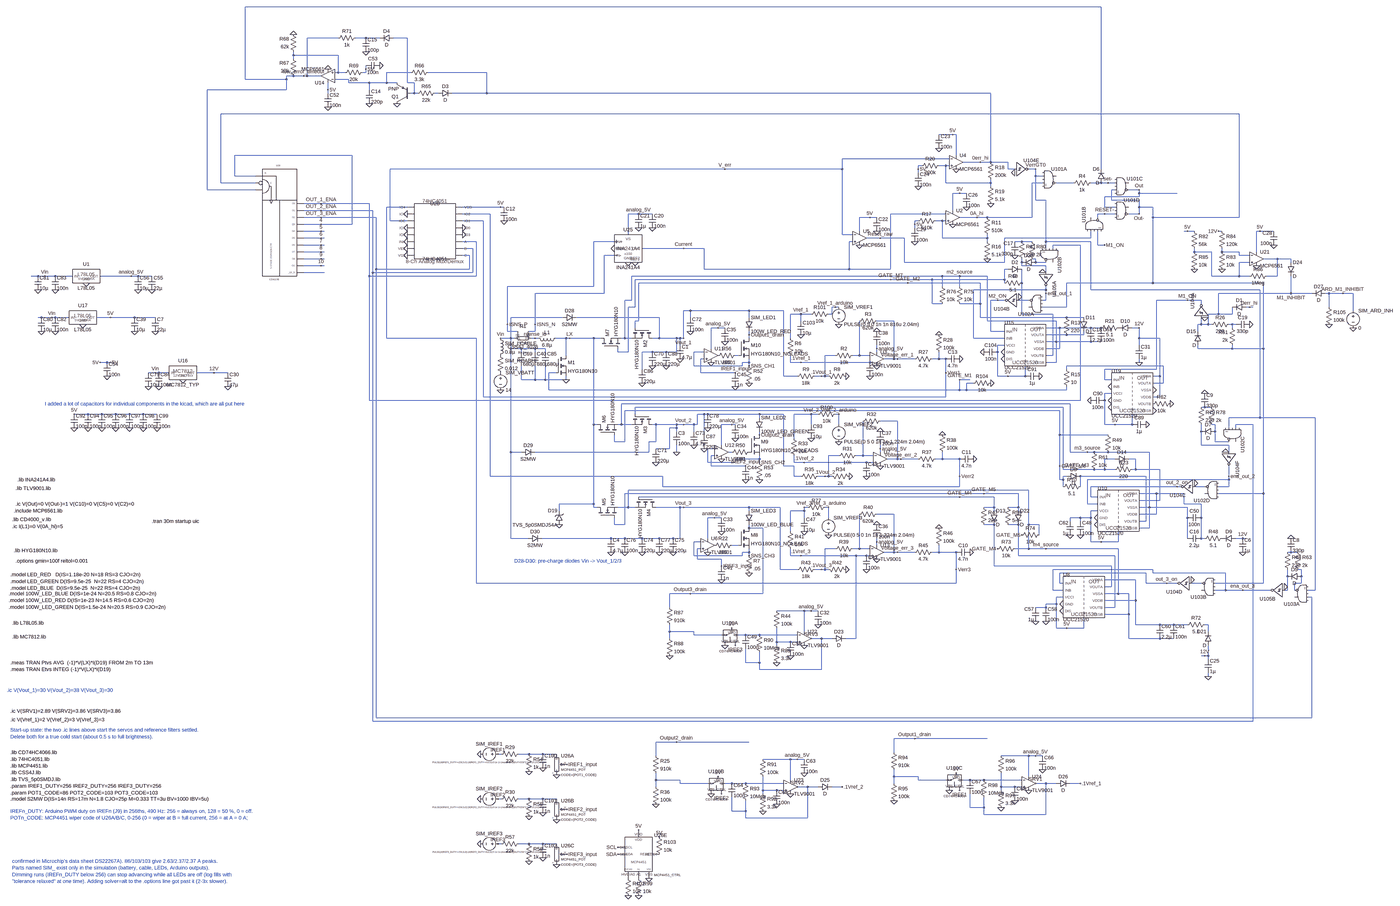
[diagram p0: schematic BOOST.asc, whole sheet]
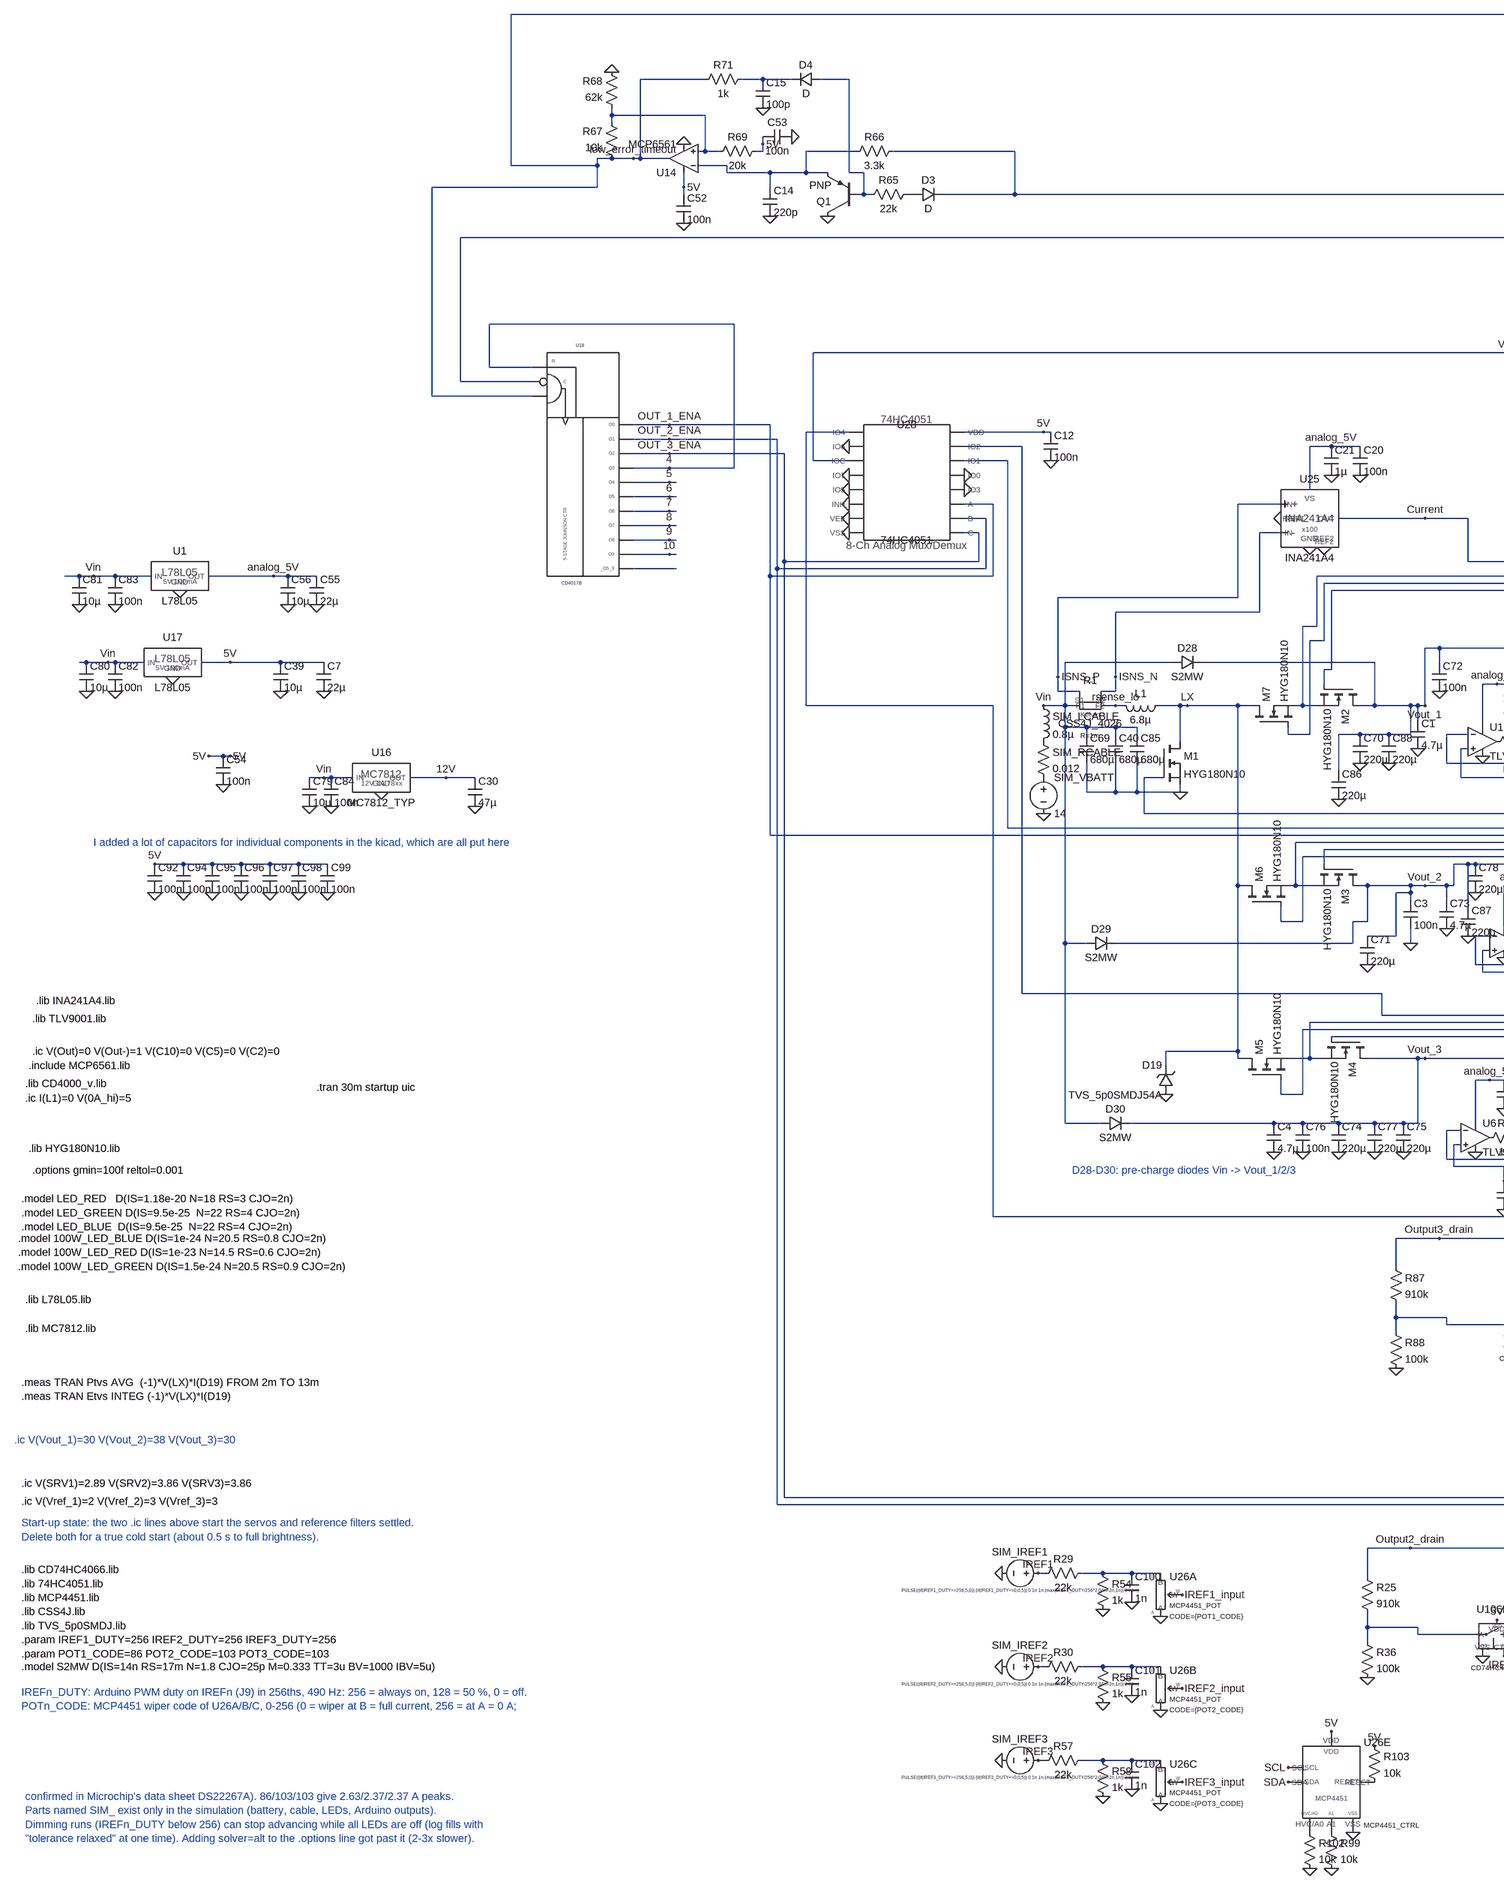
[diagram p1: schematic BOOST.asc, part, row 1 of 1, column 1 of 2]
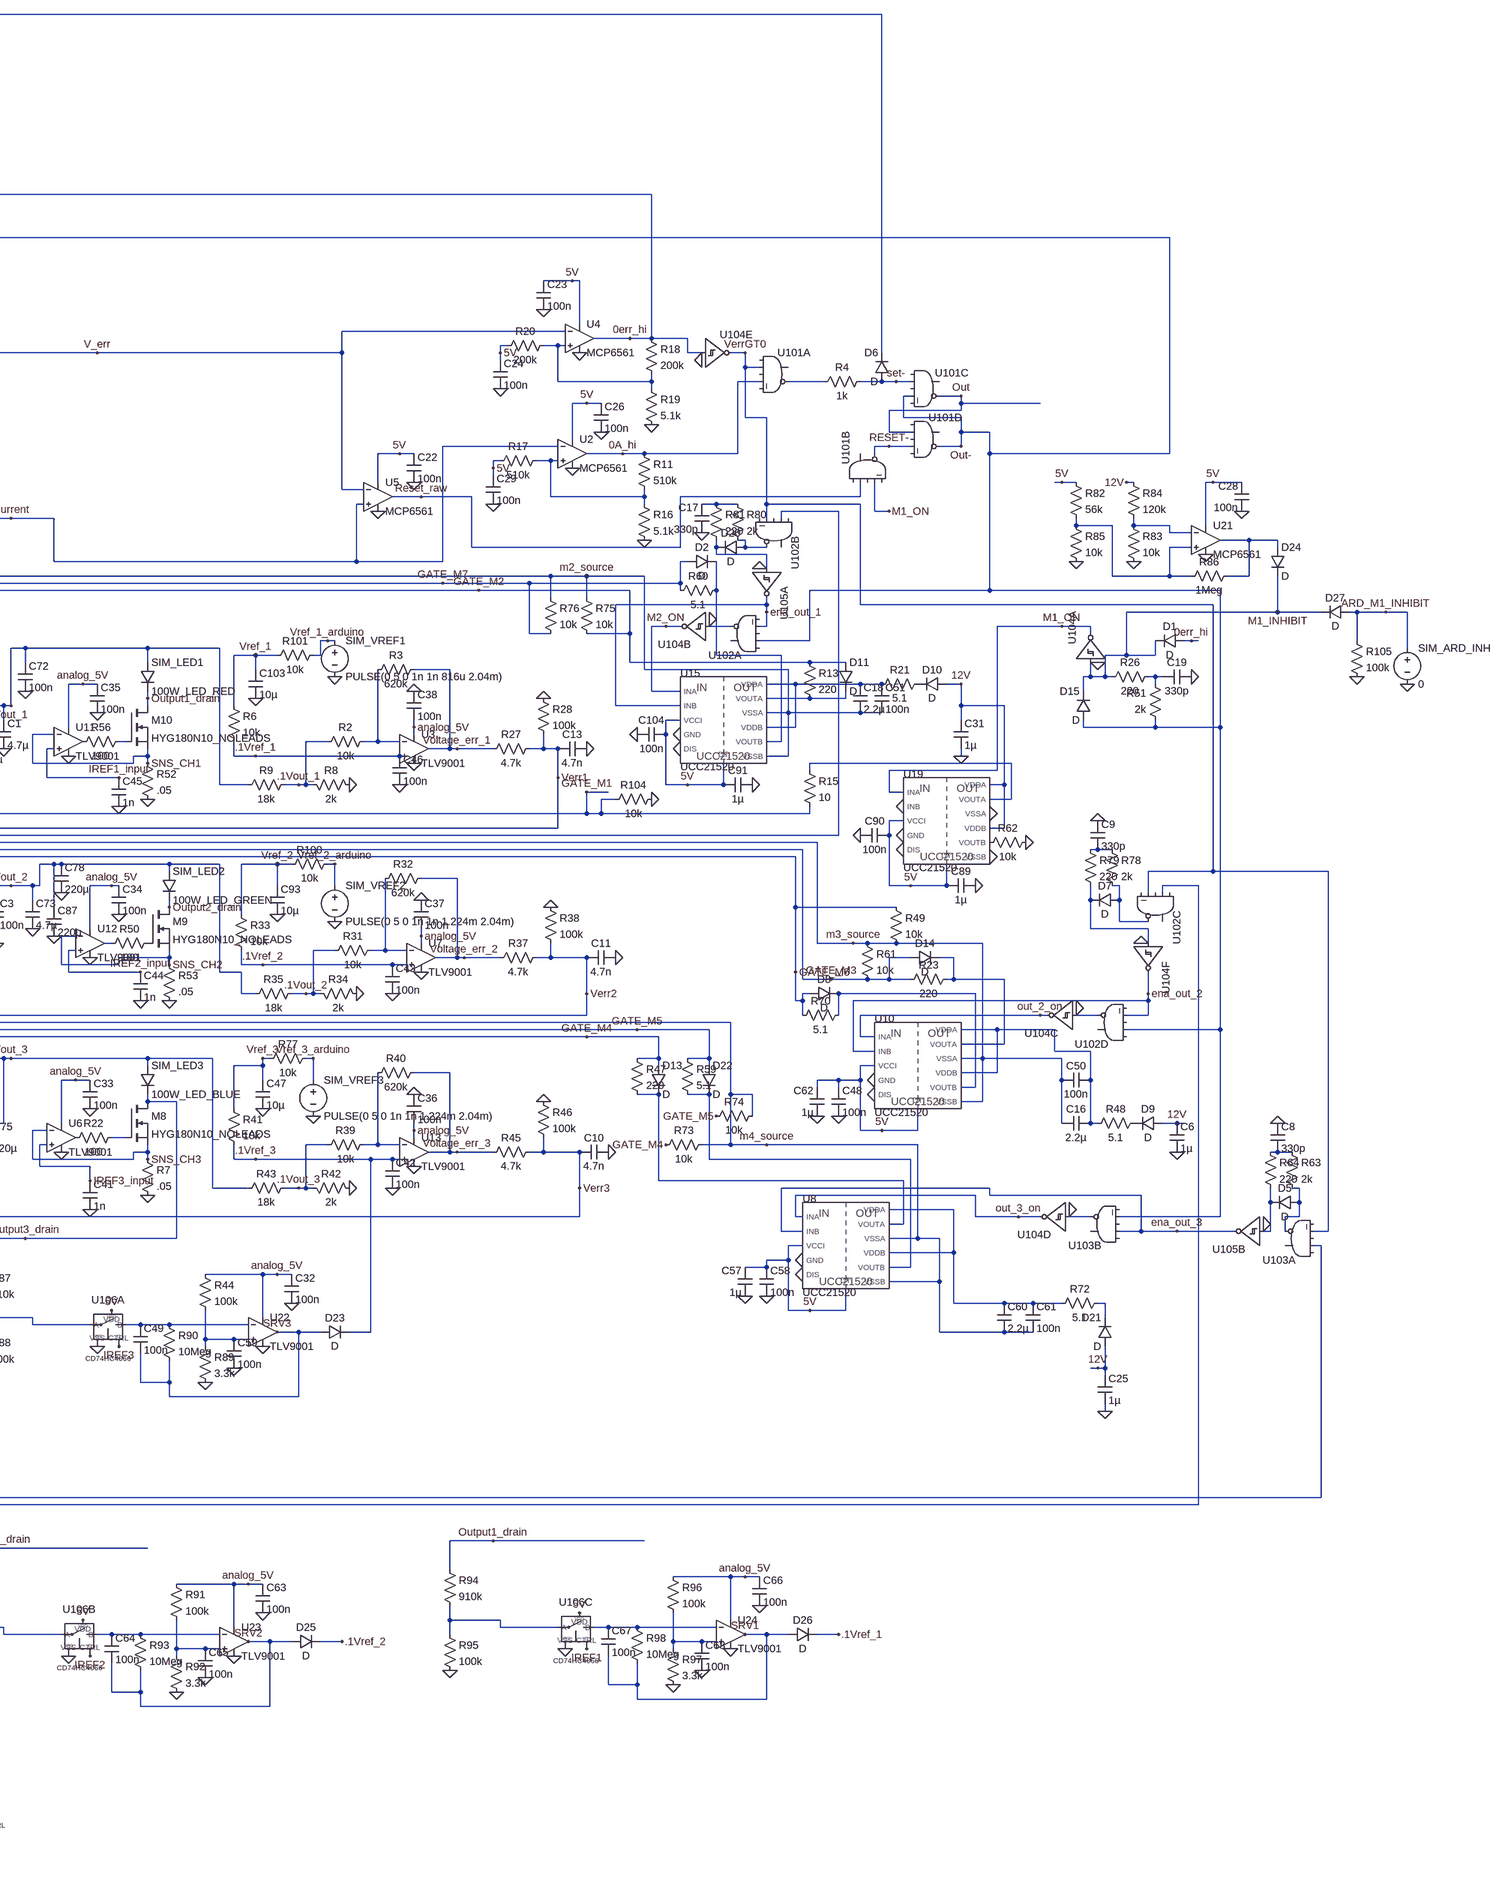
[diagram p2: schematic BOOST.asc, part, row 1 of 1, column 2 of 2]
* BOOST.asc
V§SIM_VBATT P001 0 14
L1 LX rsense_lo 6.8µ Ipk=55 Rser=1.6m
X§M1 LX GATE_M1 0 HYG180N10  ; pins D G S
X§M2 Vout_1 GATE_M2 m2_source HYG180N10  ; pins D G S
C1 Vout_1 0 4.7µ
X§R1 Vin ISNS_P ISNS_N rsense_lo CSS4J_4026 R=1m  ; pins F1 S1 S2 F2
A§U101C 0 set- 0 Out- 0 Out 0 0 AND Vhigh=5 Vlow=0 Vt=2.5 Td=2.6n Trise=8.75n Tfall=8.75n Rhigh=45 Rlow=38
A§U101D 0 Out 0 RESET- 0 Out- 0 0 AND Vhigh=5 Vlow=0 Vt=2.5 Td=2.6n Trise=8.75n Tfall=8.75n Rhigh=45 Rlow=38
A§U101A 0 VerrGT0 0 0A_hi 0 N007 0 0 AND Vhigh=5 Vlow=0 Vt=2.5 Td=2.6n Trise=8.75n Tfall=8.75n Rhigh=45 Rlow=38
R2 N022 .1Vout_1 10k
R3 Voltage_err_1 N022 620k
R6 Vref_1 .1Vref_1 10k
R8 .1Vout_1 0 2k
R9 .1Vout_1 Vout_1 18k
R11 0A_hi N008 510k
R16 N008 0 5.1k
R17 N008 5V 510k
R18 0err_hi N006 200k
R19 N006 0 5.1k
R20 N006 5V 200k
X§U2 N008 Current 5V 0 0A_hi MCP6561  ; pins In+ In- V+ V- OUT
X§U4 N006 V_err 5V 0 0err_hi MCP6561  ; pins In+ In- V+ V- OUT
X§U5 Current V_err 5V 0 Reset_raw MCP6561  ; pins In+ In- V+ V- OUT
R27 Voltage_err_1 Verr1 4.7k
R28 0 Verr1 100k
X§M3 Vout_2 GATE_M3 m3_source HYG180N10  ; pins D G S
C3 Vout_2 0 100n
X§M4 Vout_3 GATE_M4 m4_source HYG180N10  ; pins D G S
R31 N028 .1Vout_2 10k
R32 Voltage_err_2 N028 620k
R33 Vref_2 .1Vref_2 10k
R34 .1Vout_2 0 2k
R35 .1Vout_2 Vout_2 18k
R37 Voltage_err_2 Verr2 4.7k
R38 0 Verr2 100k
V§SIM_VREF3 Vref_3_arduino 0 PULSE(0 5 0 1n 1n 1.224m 2.04m)
R39 N036 .1Vout_3 10k
R40 Voltage_err_3 N036 620k
R42 .1Vout_3 0 2k
R43 .1Vout_3 Vout_3 18k
R45 Voltage_err_3 Verr3 4.7k
R46 0 Verr3 100k
X§U18 4 Out- low_error_timeout OUT_1_ENA OUT_2_ENA OUT_3_ENA 4 5 6 7 8 9 10 N015 5V 0 CD4017B VDD=5  SPEED=1.35  TRIPDT=5e-9  ; pins MR CPN CP Q0 Q1 Q2 Q3 Q4 Q5 Q6 Q7 Q8 Q9 Q59
X§M5 LX GATE_M5 m4_source HYG180N10  ; pins D G S
X§M6 LX GATE_M6 m3_source HYG180N10  ; pins D G S
X§M7 LX GATE_M7 m2_source HYG180N10  ; pins D G S
X§U28 OUT_1_ENA OUT_2_ENA OUT_3_ENA 0 0 Verr1 Verr2 0 Verr3 0 0 0 V_err 5V 0 0 74HC4051  ; pins A B C INH IO0 IO1 IO2 IO3 IO4 IO5 IO6 IO7 IOC VDD VSS VEE
A§U102A 0 Out- 0 ena_out_1 0 N017 0 0 AND Vhigh=5 Vlow=0 Vt=2.5 Td=2.6n Trise=8.75n Tfall=8.75n Rhigh=45 Rlow=38
A§U102D 0 Out- 0 ena_out_2 0 N031 0 0 AND Vhigh=5 Vlow=0 Vt=2.5 Td=2.6n Trise=8.75n Tfall=8.75n Rhigh=45 Rlow=38
A§U103B 0 ena_out_3 0 Out- 0 N041 0 0 AND Vhigh=5 Vlow=0 Vt=2.5 Td=2.6n Trise=8.75n Tfall=8.75n Rhigh=45 Rlow=38
X§M9 Output2_drain P002 SNS_CH2 HYG180N10_NOLEADS  ; pins D G S
R53 SNS_CH2 0 .05
X§M8 Output3_drain N035 SNS_CH3 HYG180N10_NOLEADS  ; pins D G S
R7 SNS_CH3 0 .05
X§M10 Output1_drain N021 SNS_CH1 HYG180N10_NOLEADS  ; pins D G S
R52 SNS_CH1 0 .05
Q1 0 N002 N004 0 PNP
R65 N002 N005 22k
R66 0err_hi N004 3.3k
C14 N004 0 220p
R67 low_error_timeout N003 10k
R68 N003 0 62k
R69 N003 5V 20k
X§U14 N003 N004 5V 0 low_error_timeout MCP6561  ; pins In+ In- V+ V- OUT
D3 N005 0err_hi D
D4 N002 N001 D
C15 N001 0 100p
R71 N001 low_error_timeout 1k
X§U13 .1Vref_3 N036 analog_5V 0 Voltage_err_3 TLV9001  ; pins In+ In- V+ V- OUT
X§U7 .1Vref_2 N028 analog_5V 0 Voltage_err_2 TLV9001  ; pins In+ In- V+ V- OUT
X§U3 .1Vref_1 N022 analog_5V 0 Voltage_err_1 TLV9001  ; pins In+ In- V+ V- OUT
C10 0 Verr3 4.7n
C11 0 Verr2 4.7n
C13 0 Verr1 4.7n
X§U25 ISNS_P ISNS_N analog_5V 0 0 0 Current INA241A4  ; pins IN+ IN- VS GND REF1 REF2 OUT
R4 set- N007 1k
D6 set- low_error_timeout D
A§U102B 0 OUT_1_ENA 0 VerrGT0 0 N012 0 0 AND Vhigh=5 Vlow=0 Vt=2.5 Td=2.6n Trise=8.75n Tfall=8.75n Rhigh=45 Rlow=38
A§U102C 0 OUT_2_ENA 0 VerrGT0 0 N025 0 0 AND Vhigh=5 Vlow=0 Vt=2.5 Td=2.6n Trise=8.75n Tfall=8.75n Rhigh=45 Rlow=38
A§U103A 0 OUT_3_ENA 0 VerrGT0 0 N038 0 0 AND Vhigh=5 Vlow=0 Vt=2.5 Td=2.6n Trise=8.75n Tfall=8.75n Rhigh=45 Rlow=38
R22 N035 P003 100
X§U6 IREF3_input SNS_CH3 analog_5V 0 P003 TLV9001  ; pins In+ In- V+ V- OUT
X§U10 out_2_on ena_out_2 5V 0 0 5V N032 N029 m3_source N032 N030 m3_source UCC21520  ; pins INA INB VCCI GND DIS DT VDDA VOUTA VSSA VDDB VOUTB VSSB
R23 N029 GATE_M3 220
C16 N032 m3_source 2.2µ
D9 12V P004 D
R48 P004 N032 5.1
X§U15 M2_ON ena_out_1 5V 0 0 5V N019 N020 m2_source N019 N016 m2_source UCC21520  ; pins INA INB VCCI GND DIS DT VDDA VOUTA VSSA VDDB VOUTB VSSB
R13 GATE_M2 N020 220
D10 12V P005 D
R21 P005 N019 5.1
C18 N019 m2_source 2.2µ
D11 GATE_M2 N020 D
R15 N023 GATE_M1 10
D14 GATE_M3 N029 D
R51 Out- N018 2k
C19 N018 0 330p
D15 Out- M1_INHIBIT D
R26 M1_INHIBIT N018 220
A§U104A M1_INHIBIT 0 0 0 0 M1_ON 0 0 SCHMITT Vhigh=5 Vlow=0 Vt=2.098 Vh=0.535 Td=7.6n Trise=8.75n Tfall=8.75n Rout=41
A§U104B N017 0 0 0 0 M2_ON 0 0 SCHMITT Vhigh=5 Vlow=0 Vt=2.098 Vh=0.535 Td=7.6n Trise=8.75n Tfall=8.75n Rout=41
A§U104D N041 0 0 0 0 out_3_on 0 0 SCHMITT Vhigh=5 Vlow=0 Vt=2.098 Vh=0.535 Td=7.6n Trise=8.75n Tfall=8.75n Rout=41
A§U104C N031 0 0 0 0 out_2_on 0 0 SCHMITT Vhigh=5 Vlow=0 Vt=2.098 Vh=0.535 Td=7.6n Trise=8.75n Tfall=8.75n Rout=41
X§U11 IREF1_input SNS_CH1 analog_5V 0 P006 TLV9001  ; pins In+ In- V+ V- OUT
X§U12 IREF2_input SNS_CH2 analog_5V 0 N027 TLV9001  ; pins In+ In- V+ V- OUT
R50 P002 N027 100
R56 N021 P006 100
R61 m3_source GATE_M3 10k
A§U105A N014 0 0 0 0 ena_out_1 0 0 SCHMITT Vhigh=5 Vlow=0 Vt=2.098 Vh=0.535 Td=7.6n Trise=8.75n Tfall=8.75n Rout=41
A§U104E 0err_hi 0 0 0 0 VerrGT0 0 0 SCHMITT Vhigh=5 Vlow=0 Vt=2.098 Vh=0.535 Td=7.6n Trise=8.75n Tfall=8.75n Rout=41
A§U104F N026 0 0 0 0 ena_out_2 0 0 SCHMITT Vhigh=5 Vlow=0 Vt=2.098 Vh=0.535 Td=7.6n Trise=8.75n Tfall=8.75n Rout=41
A§U105B N039 0 0 0 0 ena_out_3 0 0 SCHMITT Vhigh=5 Vlow=0 Vt=2.098 Vh=0.535 Td=7.6n Trise=8.75n Tfall=8.75n Rout=41
D§SIM_LED1 Vout_1 Output1_drain 100W_LED_RED
D§SIM_LED3 Vout_3 Output3_drain 100W_LED_BLUE
D§SIM_LED2 Vout_2 Output2_drain 100W_LED_GREEN
C7 5V 0 22µ
C12 5V 0 100n
C20 analog_5V 0 100n
C21 analog_5V 0 1µ
C22 5V 0 100n
C23 5V 0 100n
C24 5V 0 100n
C26 5V 0 100n
C91 0 5V 1µ
C29 5V 0 100n
C30 12V 0 47µ
C31 12V 0 1µ
C33 analog_5V 0 100n
C34 analog_5V 0 100n
C35 analog_5V 0 100n
C36 0 analog_5V 100n
C37 0 analog_5V 100n
C38 0 analog_5V 100n
C39 5V 0 10µ
C41 IREF3_input 0 1n
C42 .1Vref_3 0 100n
C43 .1Vref_2 0 100n
C44 IREF2_input 0 1n
C45 IREF1_input 0 1n
C46 .1Vref_1 0 100n
C104 5V 0 100n
C48 5V 0 100n
C50 N032 m3_source 100n
C51 N019 m2_source 100n
C52 5V 0 100n
C53 0 5V 100n
C54 5V 0 100n
C55 analog_5V 0 22µ
C56 analog_5V 0 10µ
X§U16 Vin 12V 0 MC7812_TYP  ; pins IN OUT GND
X§U17 Vin 5V 0 L78L05  ; pins IN OUT GND
D19 0 LX TVS_5p0SMDJ54A
X§U1 Vin analog_5V 0 L78L05  ; pins IN OUT GND
A§U101B 0 Reset_raw 0 M1_ON 0 RESET- 0 0 AND Vhigh=5 Vlow=0 Vt=2.5 Td=2.6n Trise=8.75n Tfall=8.75n Rhigh=45 Rlow=38
D1 0err_hi M1_INHIBIT D
X§U19 M1_ON 0 5V 0 0 5V 12V N023 0 12V P007 0 UCC21520  ; pins INA INB VCCI GND DIS DT VDDA VOUTA VSSA VDDB VOUTB VSSB
C89 0 5V 1µ
C90 5V 0 100n
R60 N016 GATE_M7 5.1
D2 GATE_M7 N016 D
X§U8 out_3_on ena_out_3 5V 0 0 5V N040 N033 m4_source N040 N034 m4_source UCC21520  ; pins INA INB VCCI GND DIS DT VDDA VOUTA VSSA VDDB VOUTB VSSB
C57 0 5V 1µ
C58 5V 0 100n
C25 12V 0 1µ
C6 12V 0 1µ
R49 GATE_M6 m3_source 10k
D8 GATE_M6 N030 D
R70 N030 GATE_M6 5.1
C60 N040 m4_source 2.2µ
C61 N040 m4_source 100n
R72 N042 N040 5.1
D21 12V N042 D
R47 GATE_M4 N033 220
D13 GATE_M4 N033 D
R59 GATE_M5 N034 5.1
D22 GATE_M5 N034 D
C62 0 5V 1µ
R62 0 P007 10k
R75 m2_source GATE_M2 10k
R76 m2_source GATE_M7 10k
R63 N037 N038 2k
D5 N038 N039 D
R64 N037 N039 220
C8 0 N037 330p
R78 N024 N025 2k
D7 N025 N026 D
R79 N024 N026 220
C9 0 N024 330p
R80 N009 N012 2k
D20 N012 N014 D
R81 N009 N014 220
C17 0 N009 330p
R82 5V N010 56k
R83 N011 0 10k
R84 12V N011 120k
X§U21 N010 N011 5V 0 N013 MCP6561  ; pins In+ In- V+ V- OUT
C28 5V 0 100n
D24 N013 M1_INHIBIT D
R85 N010 0 10k
R86 N013 N010 1Meg
R87 Output3_drain N043 910k
R88 N043 0 100k
X§U106A N043 N044 IREF3 5V 0 CD74HC4066  ; pins A B CTRL VDD VSS
X§U22 N045 N044 analog_5V 0 SRV3 TLV9001  ; pins In+ In- V+ V- OUT
C32 analog_5V 0 100n
R41 Vref_3 .1Vref_3 10k
C49 N044 SRV3 100n
R44 analog_5V N045 100k
R89 N045 0 3.3k
C59 N045 0 100n
D23 SRV3 .1Vref_3 D
R90 N044 SRV3 10Meg
R25 Output2_drain N048 910k
R36 N048 0 100k
X§U106B N048 N050 IREF2 5V 0 CD74HC4066  ; pins A B CTRL VDD VSS
X§U23 N052 N050 analog_5V 0 SRV2 TLV9001  ; pins In+ In- V+ V- OUT
C63 analog_5V 0 100n
C64 N050 SRV2 100n
R91 analog_5V N052 100k
R92 N052 0 3.3k
C65 N052 0 100n
D25 SRV2 .1Vref_2 D
R93 N050 SRV2 10Meg
R94 Output1_drain N047 910k
R95 N047 0 100k
X§U106C N047 N049 IREF1 5V 0 CD74HC4066  ; pins A B CTRL VDD VSS
X§U24 N051 N049 analog_5V 0 SRV1 TLV9001  ; pins In+ In- V+ V- OUT
C66 analog_5V 0 100n
C67 N049 SRV1 100n
R96 analog_5V N051 100k
R97 N051 0 3.3k
C68 N051 0 100n
D26 SRV1 .1Vref_1 D
R98 N049 SRV1 10Meg
C69 Vin 0 680µ V=25 Irms=5.4 Rser=0.008 Lser=4n Rpar=147k
C72 Vout_1 0 100n
C73 Vout_2 0 4.7µ
C4 Vout_3 0 4.7µ
C76 Vout_3 0 100n
C79 Vin 0 10µ
C80 Vin 0 10µ
C81 Vin 0 10µ
C82 Vin 0 100n
C83 Vin 0 100n
R§SIM_RCABLE P008 P001 0.012
C84 Vin 0 100n
C86 Vout_1 0 220µ V=50 Irms=4.5 Rser=0.01 Lser=4n Rpar=455k
L§SIM_LCABLE Vin P008 0.8µ Rser=1m
C40 Vin 0 680µ V=25 Irms=5.4 Rser=0.008 Lser=4n Rpar=147k
C70 Vout_1 0 220µ V=50 Irms=3.2 Rser=0.013 Lser=4n Rpar=455k
C71 Vout_2 0 220µ V=50 Irms=3.2 Rser=0.013 Lser=4n Rpar=455k
C78 Vout_2 0 220µ V=50 Irms=3.2 Rser=0.013 Lser=4n Rpar=455k
C74 Vout_3 0 220µ V=50 Irms=4.5 Rser=0.01 Lser=4n Rpar=455k
C85 Vin 0 680µ V=25 Irms=5.4 Rser=0.008 Lser=4n Rpar=147k
C77 Vout_3 0 220µ V=50 Irms=3.2 Rser=0.013 Lser=4n Rpar=455k
C87 Vout_2 0 220µ V=50 Irms=4.5 Rser=0.01 Lser=4n Rpar=455k
C75 Vout_3 0 220µ V=50 Irms=3.2 Rser=0.013 Lser=4n Rpar=455k
C88 Vout_1 0 220µ V=50 Irms=3.2 Rser=0.013 Lser=4n Rpar=455k
R101 Vref_1_arduino Vref_1 10k
C103 Vref_1 0 10µ
R100 Vref_2_arduino Vref_2 10k
C93 Vref_2 0 10µ
R77 Vref_3_arduino Vref_3 10k
C47 Vref_3 0 10µ
D27 ARD_M1_INHIBIT M1_INHIBIT D
V§SIM_ARD_INH ARD_M1_INHIBIT 0 0
V§SIM_VREF1 Vref_1_arduino 0 PULSE(0 5 0 1n 1n 816u 2.04m)
V§SIM_VREF2 Vref_2_arduino 0 PULSE(0 5 0 1n 1n 1.224m 2.04m)
R104 GATE_M1 0 10k
R73 m4_source GATE_M4 10k
R74 GATE_M5 m4_source 10k
R105 ARD_M1_INHIBIT 0 100k
C92 5V 0 100n
C94 5V 0 100n
C95 5V 0 100n
C96 5V 0 100n
C97 5V 0 100n
C98 5V 0 100n
C99 5V 0 100n
V§SIM_IREF1 IREF1 0 PULSE({if(IREF1_DUTY>=256,5,0)} {if(IREF1_DUTY<=0,0,5)} 0 1n 1n {max(IREF1_DUTY/256*2.04m-2n,1n)} 2.04m)
R29 N046 IREF1 22k
R54 N046 0 1k
C100 N046 0 1n
X§U26A 0 IREF1_input N046 MCP4451_POT CODE={POT1_CODE}  ; pins A W B
V§SIM_IREF2 IREF2 0 PULSE({if(IREF2_DUTY>=256,5,0)} {if(IREF2_DUTY<=0,0,5)} 0 1n 1n {max(IREF2_DUTY/256*2.04m-2n,1n)} 2.04m)
R30 N053 IREF2 22k
R55 N053 0 1k
C101 N053 0 1n
X§U26B 0 IREF2_input N053 MCP4451_POT CODE={POT2_CODE}  ; pins A W B
V§SIM_IREF3 IREF3 0 PULSE({if(IREF3_DUTY>=256,5,0)} {if(IREF3_DUTY<=0,0,5)} 0 1n 1n {max(IREF3_DUTY/256*2.04m-2n,1n)} 2.04m)
R57 N054 IREF3 22k
R58 N054 0 1k
C102 N054 0 1n
X§U26C 0 IREF3_input N054 MCP4451_POT CODE={POT3_CODE}  ; pins A W B
X§U26E 5V 0 SCL SDA P009 P010 P011 MCP4451_CTRL  ; pins VDD VSS SCL SDA HVC/A0 A1 RESET
R102 P009 0 10k
R99 P010 0 10k
R103 5V P011 10k
D28 Vin Vout_1 S2MW
D29 Vin Vout_2 S2MW
D30 Vin Vout_3 S2MW
.model D D
.lib standard.dio
.model NPN NPN
.model PNP PNP
.lib standard.bjt
.lib TLV9001.lib
.ic V(Out)=0 V(Out-)=1 V(C10)=0 V(C5)=0 V(C2)=0
.include MCP6561.lib
.tran 30m startup uic
.ic I(L1)=0 V(0A_hi)=5
.lib CD4000_v.lib
.lib HYG180N10.lib
.options gmin=100f reltol=0.001
.lib INA241A4.lib
.model LED_RED   D(IS=1.18e-20 N=18 RS=3 CJO=2n)
.model LED_GREEN D(IS=9.5e-25  N=22 RS=4 CJO=2n)
.model LED_BLUE  D(IS=9.5e-25  N=22 RS=4 CJO=2n)
.model 100W_LED_BLUE D(IS=1e-24 N=20.5 RS=0.8 CJO=2n)
.model 100W_LED_RED D(IS=1e-23 N=14.5 RS=0.6 CJO=2n)
.model 100W_LED_GREEN D(IS=1.5e-24 N=20.5 RS=0.9 CJO=2n)
.lib L78L05.lib
.lib MC7812.lib
.meas TRAN Ptvs AVG  (-1)*V(LX)*I(D19) FROM 2m TO 13m
.meas TRAN Etvs INTEG (-1)*V(LX)*I(D19)
* .ic V(Vout_1)=30 V(Vout_2)=38 V(Vout_3)=30
.ic V(SRV1)=2.89 V(SRV2)=3.86 V(SRV3)=3.86
.ic V(Vref_1)=2 V(Vref_2)=3 V(Vref_3)=3
* Start-up state: the two .ic lines above start the servos and reference filters settled.
* Delete both for a true cold start (about 0.5 s to full brightness).
.lib CD74HC4066.lib
.lib 74HC4051.lib
.lib MCP4451.lib
.lib CSS4J.lib
.lib TVS_5p0SMDJ.lib
.param IREF1_DUTY=256 IREF2_DUTY=256 IREF3_DUTY=256
.param POT1_CODE=86 POT2_CODE=103 POT3_CODE=103
* IREFn_DUTY: Arduino PWM duty on IREFn (J9) in 256ths, 490 Hz: 256 = always on, 128 = 50 %, 0 = off.
* POTn_CODE: MCP4451 wiper code of U26A/B/C, 0-256 (0 = wiper at B = full current, 256 = at A = 0 A;
* I added a lot of capacitors for individual components in the kicad, which are all put here
* confirmed in Microchip's data sheet DS22267A). 86/103/103 give 2.63/2.37/2.37 A peaks.
* Parts named SIM_ exist only in the simulation (battery, cable, LEDs, Arduino outputs).
* Dimming runs (IREFn_DUTY below 256) can stop advancing while all LEDs are off (log fills with
* "tolerance relaxed" at one time). Adding solver=alt to the .options line got past it (2-3x slower).
.model S2MW D(IS=14n RS=17m N=1.8 CJO=25p M=0.333 TT=3u BV=1000 IBV=5u)
* D28-D30: pre-charge diodes Vin -> Vout_1/2/3
.lib CSS4J.lib
.lib 74HC4051.lib
.lib INA241A4.lib
.lib UCC21520.lib
.lib MC7812.lib
.lib L78L05.lib
.lib CD74HC4066.lib
.lib MCP4451.lib
.backanno
.end